# Altium schematic sheet 04_KOM_ACB23_4009_AdditionalComponents.SchDoc: Addtional components
size A4; DocumentNumber: 2023-03-28; Revision: v0.11; SheetNumber: 4; SheetTotal: 9
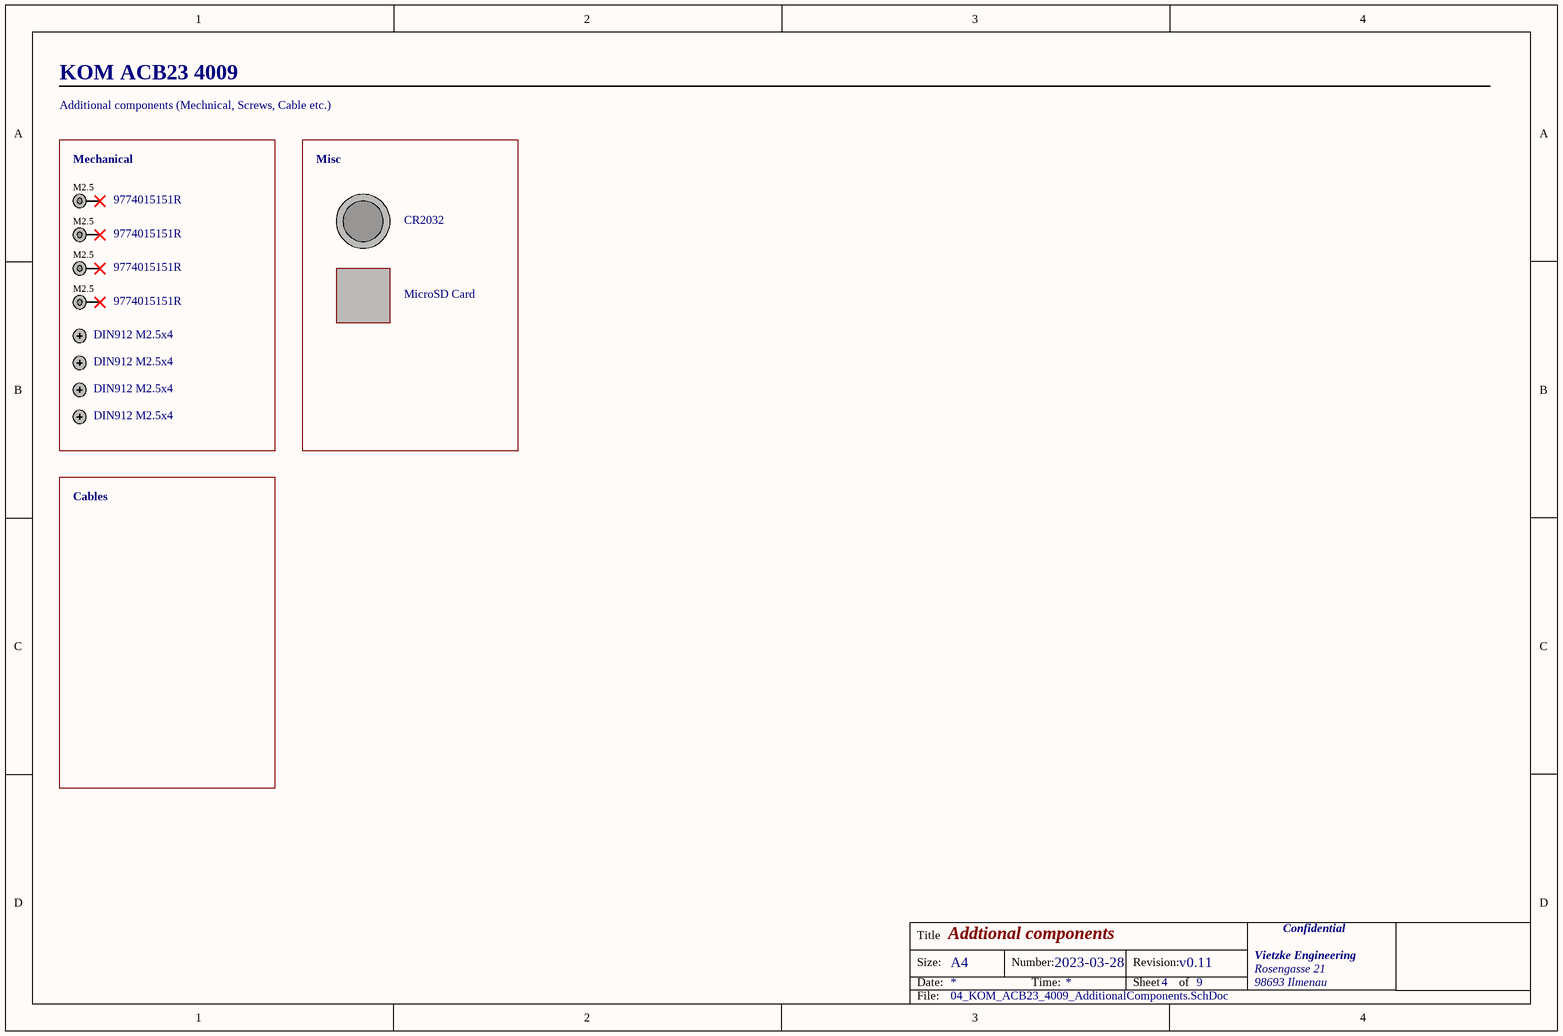
[diagram p0: 04_KOM_ACB23_4009_AdditionalComponents.SchDoc]

## Parts
BAT1  CR2032  [CR2032]
MH1  9774015151R  [9774015151R]
MH2  9774015151R  [9774015151R]
MH3  9774015151R  [9774015151R]
MH4  9774015151R  [9774015151R]
S1  DIN912 M2.5x4  [DIN912 M2.5x4]
S2  DIN912 M2.5x4  [DIN912 M2.5x4]
S3  DIN912 M2.5x4  [DIN912 M2.5x4]
S4  DIN912 M2.5x4  [DIN912 M2.5x4]
SD1  MicroSD Card  [MicroSDCard]

## Blocks framed on the sheet
Mechanical: MH1-MH4 S1-S4
Misc: BAT1 SD1

## Nets

Not connected (* = marked no-connect by the designer): MH1 1*; MH2 1*; MH3 1*; MH4 1*

## Notes on the sheet
- KOM ACB23 4009
- Additional components (Mechnical, Screws, Cable etc.)
- Cables
- Title
- Size:
- Date:
- A4
- Number:
- Time:
- Revision:
- Sheet
- of
- Vietzke Engineering
- Rosengasse 21
- 98693 Ilmenau
- Confidential
- File:
- (in symbol 9774015151R) M2.5

## Library data of the parts
BAT1 = CR2032: CR2032 Battery; Type: Mechanical
MH1-MH4 = 9774015151R: WA-SMSE SMD Steel M2.5 Internal 2.9mm; Type: THT; Supplier 1: Mouser; Supplier Part Number 1: 710-9774015151R
S1-S4 = DIN912 M2.5x4: Type: Mechanical
SD1 = MicroSD Card: Type: Mechanical